# Altium schematic sheet 01_Power_RF.SchDoc: Power & Sensors (part 1 of 4)
size A3; Date: 2026-05-09; Author: Kristijonas Čepelis; CompanyName: technologijų katedra; DrawnBy: Kristijonas Čepelis; Engineer: Kristijonas Čepelis; Organization: Vilnius TECH; Address1: Elektronikos fakultetas; Address2: Kompiuterių inžinerijos katedra; Address3: Saulėtekio al. 11,; Address4: Vilnius, Lietuva; DocumentNumber: 1; SheetNumber: 1; SheetTotal: 2
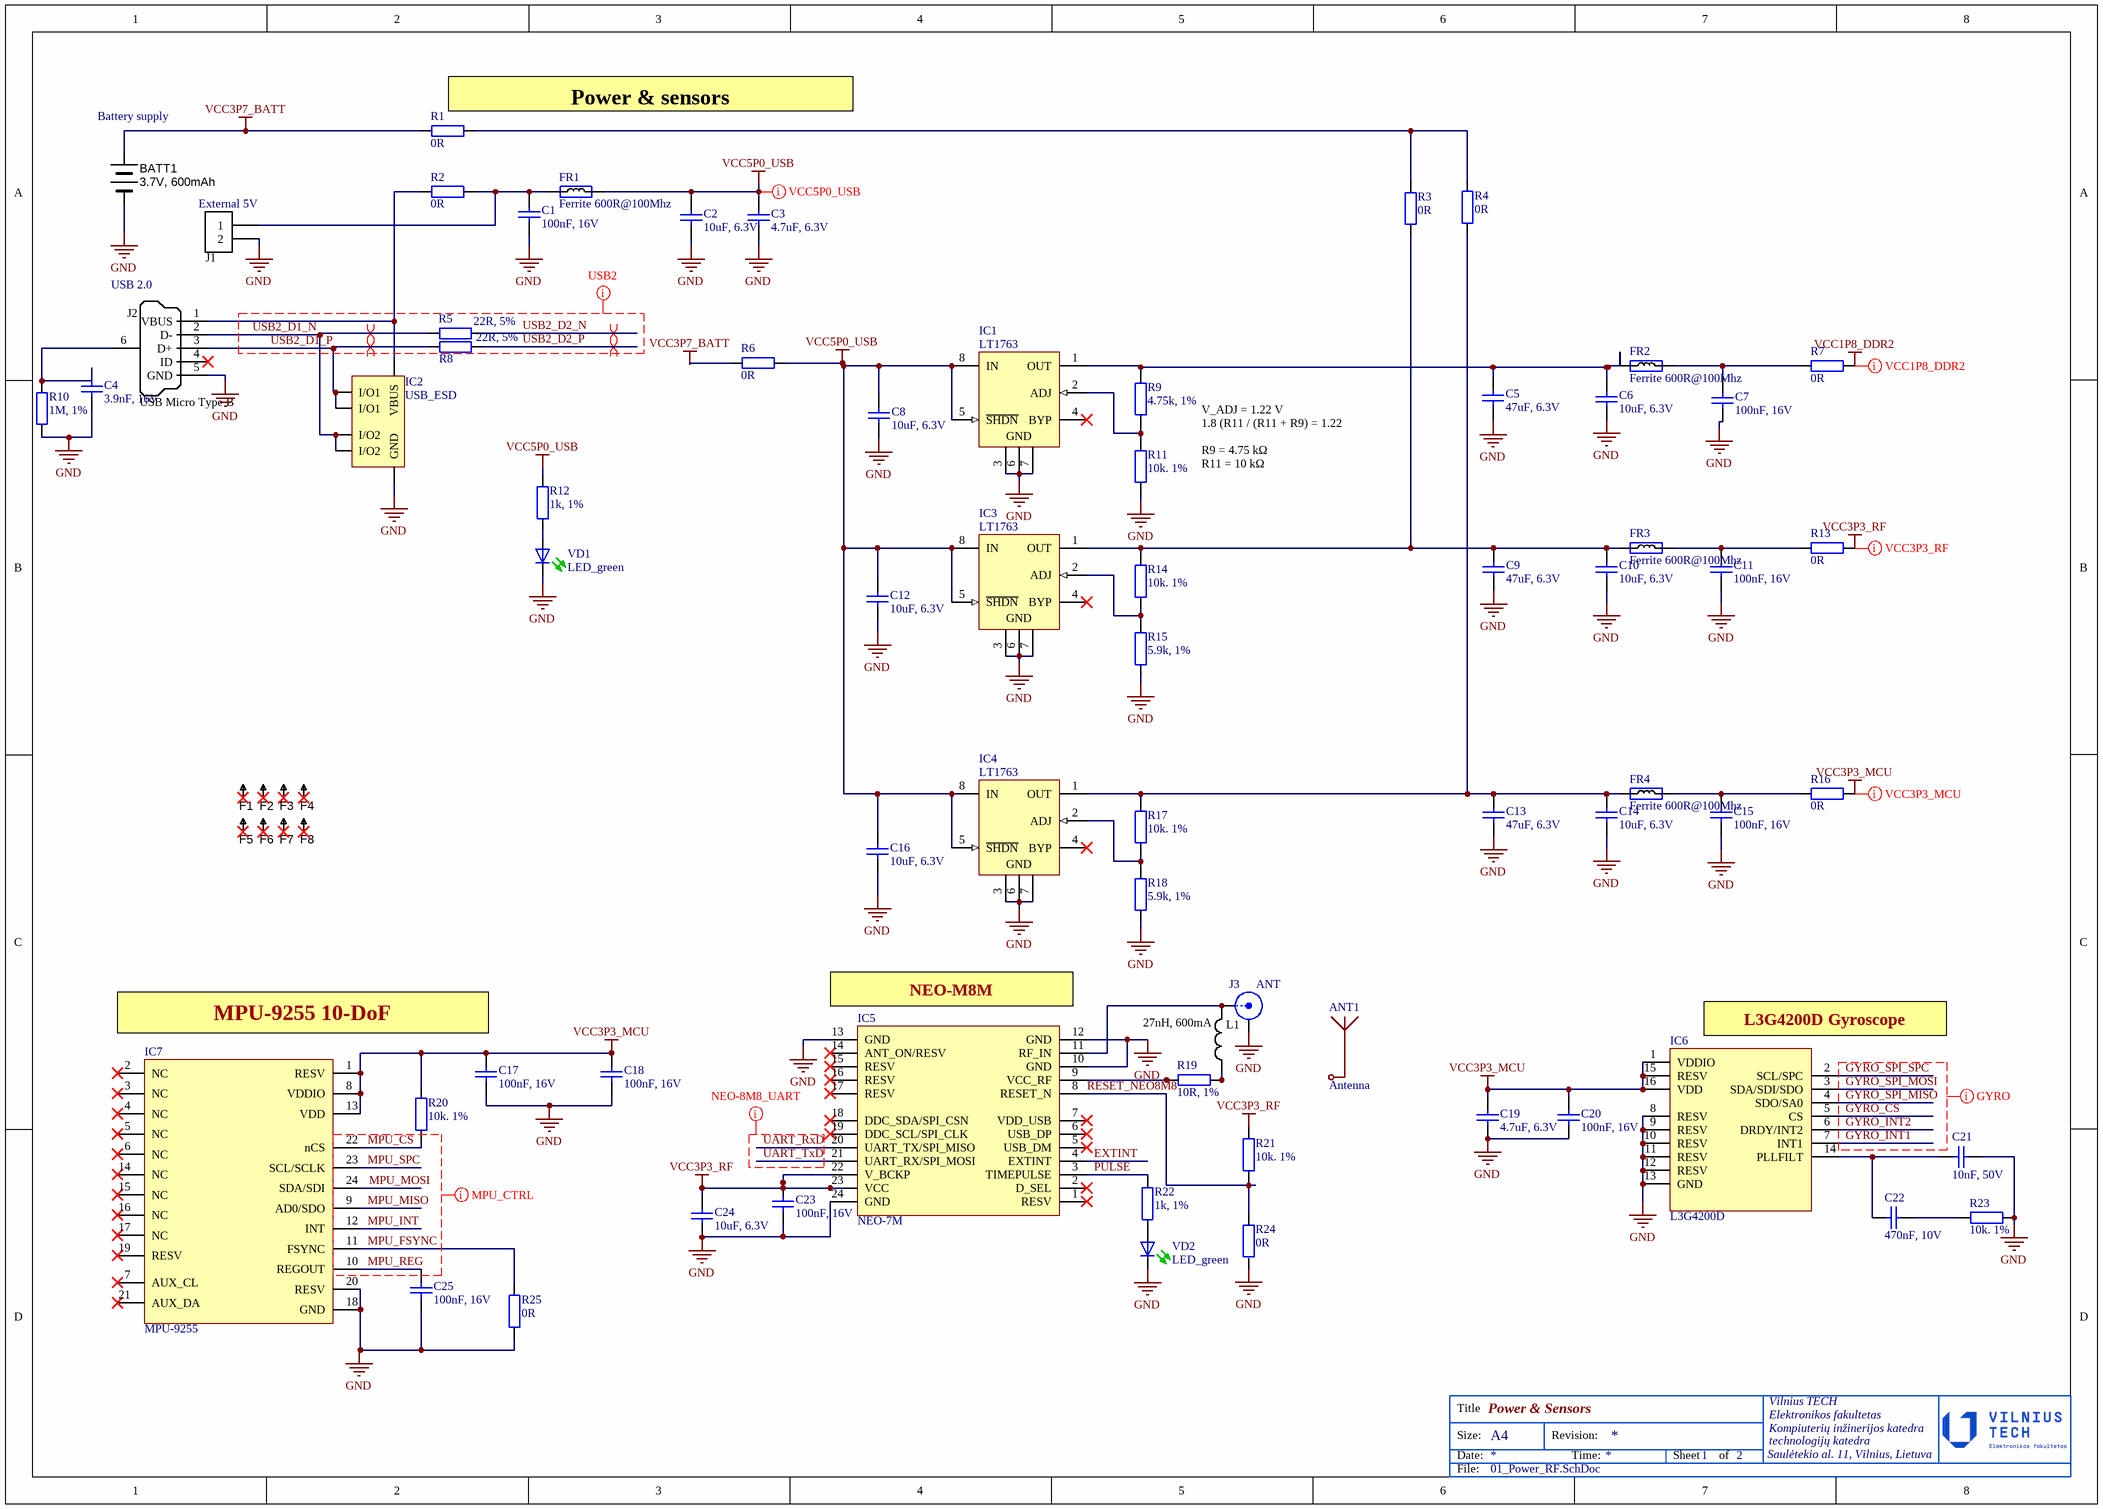
[diagram p0: 01_Power_RF.SchDoc]

## Parts
ANT1  Antenna  (mechanical)
BATT1  3.7V, 600mAh  [HDR_1x2]  (no BOM)
C1  100nF, 16V  [CAP0402]
C2  10uF, 6.3V  [CAP0402]
C3  4.7uF, 6.3V  [CAP0402]
C4  3.9nF, 16V  [CAP0402]
C5  47uF, 6.3V  [CAP0805]
C6  10uF, 6.3V  [CAP0402]
C7  100nF, 16V  [CAP0402]
C8  10uF, 6.3V  [CAP0402]
C9  47uF, 6.3V  [CAP0805]
C10  10uF, 6.3V  [CAP0402]
C11  100nF, 16V  [CAP0402]
C12  10uF, 6.3V  [CAP0402]
C13  47uF, 6.3V  [CAP0805]
C14  10uF, 6.3V  [CAP0402]
C15  100nF, 16V  [CAP0402]
C16  10uF, 6.3V  [CAP0402]
C17  100nF, 16V  [CAP0402]
C18  100nF, 16V  [CAP0402]
C19  4.7uF, 6.3V  [CAP0402]
C20  100nF, 16V  [CAP0402]
C21  10nF, 50V  [CAP0402]
C22  470nF, 10V  [CAP0402]
C23  100nF, 16V  [CAP0402]
C24  10uF, 6.3V  [CAP0402]
C25  100nF, 16V  [CAP0402]
F1  Fiducial  [Fiducial]  (value not drawn)  (no BOM)
F2  Fiducial  [Fiducial]  (value not drawn)  (no BOM)
F3  Fiducial  [Fiducial]  (value not drawn)  (no BOM)
F4  Fiducial  [Fiducial]  (value not drawn)  (no BOM)
F5  Fiducial  [Fiducial]  (value not drawn)  (no BOM)
F6  Fiducial  [Fiducial]  (value not drawn)  (no BOM)
F7  Fiducial  [Fiducial]  (value not drawn)  (no BOM)
F8  Fiducial  [Fiducial]  (value not drawn)  (no BOM)
FR1  Ferrite 600R@100Mhz  [RES0603]
FR2  Ferrite 600R@100Mhz  [RES0603]
FR3  Ferrite 600R@100Mhz  [RES0603]
FR4  Ferrite 600R@100Mhz  [RES0603]
IC1  LT1763  [LT-S8-8_M]
IC2  USB_ESD  [USBULC6]
IC3  LT1763  [LT-S8-8_M]
IC4  LT1763  [LT-S8-8_M]
IC5  NEO-7M  [NEO-M8M]
IC6  L3G4200D  [LGA16-4X4X1.1_N]
IC7  MPU-9255  [MPU-9255]
J1  Header 2x1 pin  [HDR_1x2]  (value not drawn)
J2  USB Micro Type B  [microUSB]
J3  ANT  [MMCX_UFL_conn_u]
L1  27nH, 600mA  [RES0603]
R1  0R  [RES0402]
R2  0R  [RES0402]
R3  0R  [RES0402]
R4  0R  [RES0402]
R5  22R, 5%  [RES0402]
R6  0R  [RES0402]
R7  0R  [RES0402]
R8  22R, 5%  [RES0402]
R9  4.75k, 1%  [RES0402]
R10  1M, 1%  [RES0402]
R11  10k. 1%  [RES0402]
R12  1k, 1%  [RES0402]
R13  0R  [RES0402]
R14  10k. 1%  [RES0402]
R15  5.9k, 1%  [RES0402]
R16  0R  [RES0402]
R17  10k. 1%  [RES0402]
R18  5.9k, 1%  [RES0402]
R19  10R, 1%  [RES0402]
R20  10k. 1%  [RES0402]
R21  10k. 1%  [RES0402]
R22  1k, 1%  [RES0402]
R23  10k. 1%  [RES0402]
R24  0R  [RES0402]
R25  0R  [RES0402]
VD1  LED_green  [LED-0603-GREEN]
VD2  LED_green  [LED-0603-GREEN]

## Nets
GND: BATT1.2 C1.1 C2.1 C3.1 C4.1 C5.1 C6.1 C7.2 C8.1 C9.1 C10.1 C11.1 C12.1 C13.1 C14.1 C15.1 C16.1 C17.1 C18.1 C19.1 C20.1 C21.1 C23.1 C24.1 C25.1 IC1.3(GND) IC1.6(GND) IC1.7(GND) IC2.2(GND) IC3.3(GND) IC3.6(GND) IC3.7(GND) IC4.3(GND) IC4.6(GND) IC4.7(GND) IC5.10(GND) IC5.12(GND) IC5.13(GND) IC5.24(GND) IC6.8(RESV) IC6.9(RESV) IC6.10(RESV) IC6.11(RESV) IC6.12(RESV) IC6.13(GND) IC7.18(GND) IC7.20(RESV) J1.2 J2.5(GND) J3.2(Y) R10.1 R11.1 R15.1 R18.1 R23.2 R24.1 R25.1 VD1.K(C) VD2.K(C)
VCC1P8_DDR2: R7.2
VCC3P3_MCU: C17.2 C18.2 C19.2 C20.2 IC6.1(VDDIO) IC6.15(RESV) IC6.16(VDD) IC7.1(RESV) IC7.8(VDDIO) IC7.13(VDD) R16.2 R20.2
VCC3P3_RF: C23.2 C24.2 IC5.22(V_BCKP) IC5.23(VCC) R13.2 R21.2
VCC3P7_BATT: BATT1.1 R1.1 R6.1
VCC5P0_USB: C2.2 C3.2 C8.2 C12.2 C16.2 FR1.2 IC1.5(~{SHDN}) IC1.8(IN) IC3.5(~{SHDN}) IC3.8(IN) IC4.5(~{SHDN}) IC4.8(IN) R6.2 R12.2
EXTINT: IC5.4(EXTINT)
GYRO_CS: IC6.5(CS)
GYRO_INT1: IC6.7(INT1)
GYRO_INT2: IC6.6(DRDY/INT2)
GYRO_SPI_MISO: IC6.4(SDO/SA0)
GYRO_SPI_MOSI: IC6.3(SDA/SDI/SDO)
GYRO_SPI_SPC: IC6.2(SCL/SPC)
MPU_CS: IC7.22(nCS) R20.1
MPU_FSYNC: IC7.11(FSYNC) R25.2
MPU_INT: IC7.12(INT)
MPU_MISO: IC7.9(AD0/SDO)
MPU_MOSI: IC7.24(SDA/SDI)
MPU_REG: C25.2 IC7.10(REGOUT)
MPU_SPC: IC7.23(SCL/SCLK)
PULSE: IC5.3(TIMEPULSE) R22.2
RESET_NEO8M8: IC5.8(RESET_N) R21.1 R24.2
UART_RxD: IC5.20(UART_TX/SPI_MISO)
UART_TxD: IC5.21(UART_RX/SPI_MOSI)
USB2_D1_N: IC2.3(I/O2) IC2.4(I/O2) J2.2(D-) R5.1
USB2_D1_P: IC2.1(I/O1) IC2.6(I/O1) J2.3(D+) R8.1
USB2_D2_N: R5.2
USB2_D2_P: R8.2
NetC1_2: C1.2 FR1.1 J1.1 R2.2
NetC4_2: C4.2 J2.6(Shell) R10.2
NetC5_2: C5.2 C6.2 FR2.1 IC1.1(OUT) R9.2
NetC7_1: C7.1 FR2.2 R7.1
NetC9_2: C9.2 C10.2 FR3.1 IC3.1(OUT) R3.1 R14.2
NetC11_2: C11.2 FR3.2 R13.1
NetC13_2: C13.2 C14.2 FR4.1 IC4.1(OUT) R4.1 R17.2
NetC15_2: C15.2 FR4.2 R16.1
NetC21_2: C21.2 C22.2 IC6.14(PLLFILT)
NetC22_1: C22.1 R23.1
NetIC1_2: IC1.2(ADJ) R9.1 R11.2
NetIC2_5: IC2.5(VBUS) J2.1(VBUS) R2.1
NetIC3_2: IC3.2(ADJ) R14.1 R15.2
NetIC4_2: IC4.2(ADJ) R17.1 R18.2
NetIC5_9: IC5.9(VCC_RF) R19.1
NetIC5_11: IC5.11(RF_IN) J3.1(X) L1.2
NetL1_1: L1.1 R19.2
NetR1_2: R1.2 R3.2 R4.2
NetR12_1: R12.1 VD1.A
NetR22_1: R22.1 VD2.A

Not connected (* = marked no-connect by the designer): F1 1*; F2 1*; F3 1*; F4 1*; F5 1*; F6 1*; F7 1*; F8 1*; IC1 4(BYP)*; IC3 4(BYP)*; IC4 4(BYP)*; IC5 1(RESV)* 2(D_SEL)* 5(USB_DM)* 6(USB_DP)* 7(VDD_USB)* 14(ANT_ON/RESV)* 15(RESV)* 16(RESV)* 17(RESV)* 18(DDC_SDA/SPI_CSN)* 19(DDC_SCL/SPI_CLK)*; IC7 2(NC)* 3(NC)* 4(NC)* 5(NC)* 6(NC)* 7(AUX_CL)* 14(NC)* 15(NC)* 16(NC)* 17(NC)* 19(RESV)* 21(AUX_DA)*; J2 4(ID)*

## Layout directives
differential pair: USB2_D1_N, USB2_D1_P, USB2_D2_N, USB2_D2_P
mark named VCC1P8_DDR2: VCC1P8_DDR2
mark named VCC3P3_RF: VCC3P3_RF
mark named VCC3P3_MCU: VCC3P3_MCU
mark named USB2: USB2_D1_N, USB2_D1_P, USB2_D2_N, USB2_D2_P
mark named VCC5P0_USB: VCC5P0_USB
mark named MPU_CTRL: MPU_CS, MPU_FSYNC, MPU_INT, MPU_MISO, MPU_MOSI, MPU_REG, MPU_SPC
mark named GYRO: GYRO_CS, GYRO_INT1, GYRO_INT2, GYRO_SPI_MISO, GYRO_SPI_MOSI, GYRO_SPI_SPC
mark named NEO-8M8_UART: UART_RxD, UART_TxD

## Notes on the sheet
- (near R1) Power & sensors
- (near BATT1) Battery supply
- (near J1) External 5V
- (near J2) USB 2.0
- V_ADJ = 1.22 V
  1.8 (R11 / (R11 + R9) = 1.22
  R9 = 4.75 kΩ
  R11 = 10 kΩ
- MPU-9255 10-DoF
- (near IC5) NEO-M8M
- (near IC6) L3G4200D Gyroscope
- Title
- Size:
- Date:
- A4
- Revision:
- Time:
- Sheet
- of
- File: